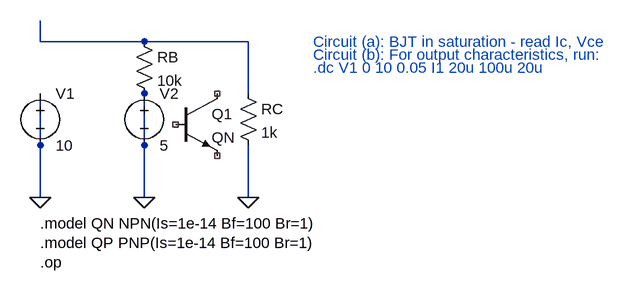
[diagram p0: schematic Ex01.asc]
Ex01.asc, the LTspice schematic file:
Version 4
SHEET 1 1920 1080
WIRE 80 80 80 48
WIRE 240 80 80 80
WIRE 400 80 240 80
WIRE 400 160 400 80
WIRE 240 240 240 160
WIRE 80 240 80 160
WIRE 80 320 80 240
WIRE 240 320 240 240
WIRE 400 320 400 240
FLAG 80 320 0
FLAG 240 320 0
FLAG 400 320 0
SYMBOL voltage 80 144 R0
WINDOW 123 0 0 Left 0
WINDOW 39 0 0 Left 0
SYMATTR InstName V1
SYMATTR Value 10
SYMBOL voltage 240 144 R0
WINDOW 123 0 0 Left 0
WINDOW 39 0 0 Left 0
SYMATTR InstName V2
SYMATTR Value 5
SYMBOL res 224 64 R0
SYMATTR InstName RB
SYMATTR Value 10k
SYMBOL res 384 144 R0
SYMATTR InstName RC
SYMATTR Value 1k
SYMBOL npn 288 160 R0
SYMATTR InstName Q1
SYMATTR Value QN
NET 80 80 vcc
NET 240 80 vbb
NET 400 80 c
NET 288 208 b
NET 288 272 e
TEXT 80 360 Left 2 !.model QN NPN(Is=1e-14 Bf=100 Br=1)
TEXT 80 390 Left 2 !.model QP PNP(Is=1e-14 Bf=100 Br=1)
TEXT 80 420 Left 2 !.op
TEXT 500 80 Left 2 ;Circuit (a): BJT in saturation - read Ic, Vce
TEXT 500 100 Left 2 ;Circuit (b): For output characteristics, run:
TEXT 500 120 Left 2 ;.dc V1 0 10 0.05 I1 20u 100u 20u

The netlist it stands for:
* Ex01.asc
V1 0 0 10
V2 0 0 5
RB N001 0 10k
RC N001 0 1k
Q1 NC_01 NC_02 NC_03 0 QN
.model NPN NPN
.model PNP PNP
.lib standard.bjt
.model QN NPN(Is=1e-14 Bf=100 Br=1)
.model QP PNP(Is=1e-14 Bf=100 Br=1)
.op
* Circuit (a): BJT in saturation - read Ic, Vce
* Circuit (b): For output characteristics, run:
* .dc V1 0 10 0.05 I1 20u 100u 20u
.backanno
.end